# Altium schematic sheet radar sch.SchDoc
size A4; SheetNumber: 3; SheetTotal: 4
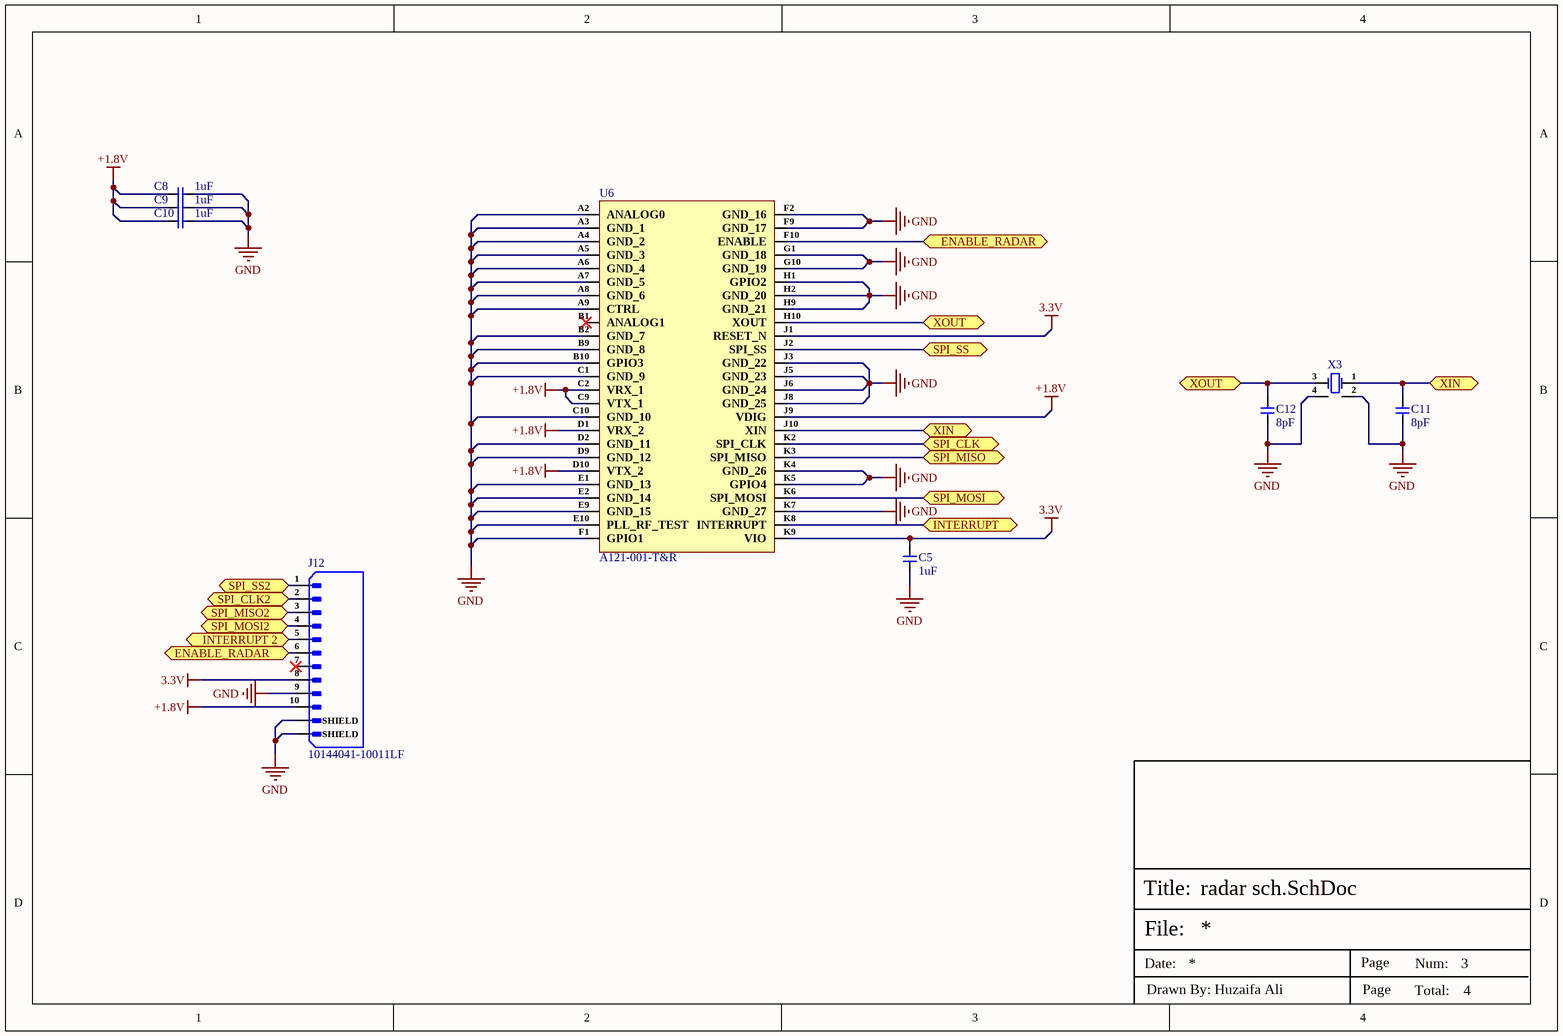
[diagram p0: radar sch.SchDoc]

## Parts
C5  1uF  [Cap-0402]
C8  1uF  [Cap-0402]
C9  1uF  [Cap-0402]
C10  1uF  [Cap-0402]
C11  8pF  [Cap-0402]
C12  8pF  [Cap-0402]
J12  10144041-10011LF  [10144041-10011LF]
U6  A121-001-T&R  [50-FCCSP (5.2x5.5)]
X3  ECS-240-8-36-RWN-TR3  [SMD2520-4P]  (value not drawn)

## Ports
ENABLE_RADAR (bidir), INTERRUPT 2 (bidir), INTERRUPT (bidir), SPI_CLK2 (bidir), SPI_CLK (bidir), SPI_MISO2 (bidir), SPI_MISO (bidir), SPI_MOSI2 (bidir), SPI_MOSI (bidir), SPI_SS2 (bidir), SPI_SS (bidir), XIN (bidir), XOUT (bidir)

## Nets
3.3V: C5.2 J12.8 U6.J1(RESET_N) U6.K9(VIO)
+1.8V: C8.1 C9.1 C10.1 J12.10 U6.C2(VRX_1) U6.C9(VTX_1) U6.D1(VRX_2) U6.D10(VTX_2) U6.J9(VDIG)
GND: C5.1 C8.2 C9.2 C10.2 C11.1 C12.1 J12.9 J12.S1(SHIELD) U6.A2(ANALOG0) U6.A3(GND_1) U6.A4(GND_2) U6.A5(GND_3) U6.A6(GND_4) U6.A7(GND_5) U6.A8(GND_6) U6.A9(CTRL) U6.B2(GND_7) U6.B9(GND_8) U6.B10(GPIO3) U6.C1(GND_9) U6.C10(GND_10) U6.D2(GND_11) U6.D9(GND_12) U6.E1(GND_13) U6.E2(GND_14) U6.E9(GND_15) U6.E10(PLL_RF_TEST) U6.F1(GPIO1) U6.F2(GND_16) U6.F9(GND_17) U6.G1(GND_18) U6.G10(GND_19) U6.H1(GPIO2) U6.H2(GND_20) U6.H9(GND_21) U6.J3(GND_22) U6.J5(GND_23) U6.J6(GND_24) U6.J8(GND_25) U6.K4(GND_26) U6.K5(GPIO4) U6.K7(GND_27) X3.2(GND) X3.4(GND)
ENABLE_RADAR: J12.6 U6.F10(ENABLE) ; port ENABLE_RADAR
INTERRUPT: U6.K8(INTERRUPT) ; port INTERRUPT
INTERRUPT 2: J12.5 ; port INTERRUPT 2
SPI_CLK: U6.K2(SPI_CLK) ; port SPI_CLK
SPI_CLK2: J12.2 ; port SPI_CLK2
SPI_MISO: U6.K3(SPI_MISO) ; port SPI_MISO
SPI_MISO2: J12.3 ; port SPI_MISO2
SPI_MOSI: U6.K6(SPI_MOSI) ; port SPI_MOSI
SPI_MOSI2: J12.4 ; port SPI_MOSI2
SPI_SS: U6.J2(SPI_SS) ; port SPI_SS
SPI_SS2: J12.1 ; port SPI_SS2
XIN: C11.2 U6.J10(XIN) X3.1(IN/OUT) ; port XIN
XOUT: C12.2 U6.H10(XOUT) X3.3(Out/In) ; port XOUT

Not connected (* = marked no-connect by the designer): J12 7*; U6 B1(ANALOG1)*

## Notes on the sheet
- File:
- Title:
- Date:
- Page
- Num:
- Total:
- Drawn By: Huzaifa Ali

## Library data of the parts
C5 C8-C10 = CC0402KRX5R6BB105: CAP CER 1UF 10V X5R 0402; Manufacturer: Yageo; Tolerance: 10%; Dissipation Factor: 15%; Item Type: Capacitor; Supplier 1: Mouser; Manufacturer Part Number: CC0402KRX5R6BB105; RoHS: Yes; Category: Ceramic Capacitors; Stock 1: 6711367; Pricing 1: 1=0.11000, 10=0.05500, 50=0.05500, 100=0.03300, 500=0.02700, 1000=0.02200, 2500=0.02100, 10000=0.01800 (USD); Mount: Surface Mount; Case/Package: 0402; Number of Pins: 2; Case Code (Metric): 1005; Case Code (Imperial): 0402; Min Operating Temperature: -55°C; Max Operating Temperature: 85°C; Capacitance: 1uF; Dielectric: X5R; Package Quantity: 1; Voltage Rating: 10V; Packaging: Tape and Reel; Voltage Rating (DC): 10V; Termination: SMD/SMT; Resistor Type: Ceramic; Series: CC; Construction: Flat; Length: 1mm; Width: 0.02inch; Height: 0.5mm; Thickness: 0.022inch; Depth: 0.5mm; Radiation Hardening: No; REACH SVHC: No SVHC; Lead Free: Lead Free; Halogen Free: Halogen Free; RoHS Compliant: Yes; ComponentLink1URL: https://datasheet.ciiva.com/176/upy-gphc-x5r-4v-to-50v-12-176704.pdf?src-supplier=Digi-Key; ComponentLink1Description: https://datasheet.ciiva.com/176/upy-gphc-x5r-4v-to-50v-12-176704.pdf?src-supplier=Digi-Key; ComponentLink2URL: https://datasheet.ciiva.com/176/mlccorderingcode-176705.pdf?src-supplier=Digi-Key; ComponentLink2Description: https://datasheet.ciiva.com/176/mlccorderingcode-176705.pdf?src-supplier=Digi-Key; ComponentLink3URL: https://datasheet.ciiva.com/176/mlccorderingcode-176706.pdf?src-supplier=Digi-Key; ComponentLink3Description: https://datasheet.ciiva.com/176/mlccorderingcode-176706.pdf?src-supplier=Digi-Key; Supplier Part Number 1: 603-CC402KRX5R6BB105; LCSC Part Number: C106254
C11 C12 = 0402CG8R0C500NT: 50V 8pF C0G 0402 Multilayer Ceramic Capacitors MLCC - SMD/SMT ROHS; Manufacturer: FH (Guangdong Fenghua Advanced Tech); Manufacturer Part Number: 0402CG8R0C500NT; Package: 0402; LCSC Part Number: C1578; Item Type: Capacitor; ComponentLink1Description: LCSC; ComponentLink1URL: https://www.lcsc.com/product-detail/Multilayer-Ceramic-Capacitors-MLCC-SMD-SMT_FH-Guangdong-Fenghua-Advanced-Tech-0402CG8R0C500NT_C1578.html
J12 = 10144041-10011LF: CONN HEADER SMD R/A 10POS 0.8MM; Manufacturer: Amphenol ICC (FCI); Item Type: Right Angle Connector; Package: Custom; Manufacturer Part Number: 10144041-10011LF
U6 = A121-001-T&R: RADAR SENSOR SYSTEM-IN-PACKAGE B; Manufacturer: Acconeer; Item Type: IC; Supplier: Mouser; Supplier Part Number: 925-A121-001-T&R; Manufacturer Part Number: A121-001-T&R; RoHS: No; Category: LDO; Stock: 7442; Pricing: 1=13.72, 10=11.57, 50=10.22, 100=8.78, 1000=7.74, 10000=6.41 (USD)
X3 = ECS-240-8-36-RWN-TR3: CRYSTAL 24.0000MHZ 8PF SMD; Manufacturer: ECS Inc.; Package: None; Manufacturer Part Number: ECS-240-8-36-RWN-TR3; Item Type: Crystal